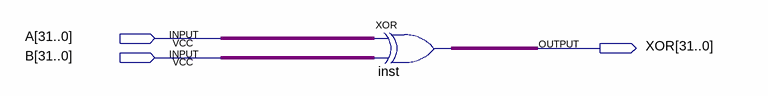
[diagram p0: schematic sheet]
// Quartus schematic Xor_32bit.bdf as structural Verilog: 1 symbols, 3 pins
module Xor_32bit (
  input  [31:0] A,
  input  [31:0] B,
  output [31:0] XOR
);

  assign XOR = A ^ B;  // XOR inst, 32 bits wide
endmodule
